# Altium project DT10965_MOTOR_CONTROLLER.PrjPcb (part 4 of 6)

## Sheet Phase_Current_Voltage_Sense.SchDoc: =DT_SCH_Title
size A3; Organization: Droid Technologies; DocumentNumber: DT10965; Revision: 1.0; SheetNumber: 20; SheetTotal: 21
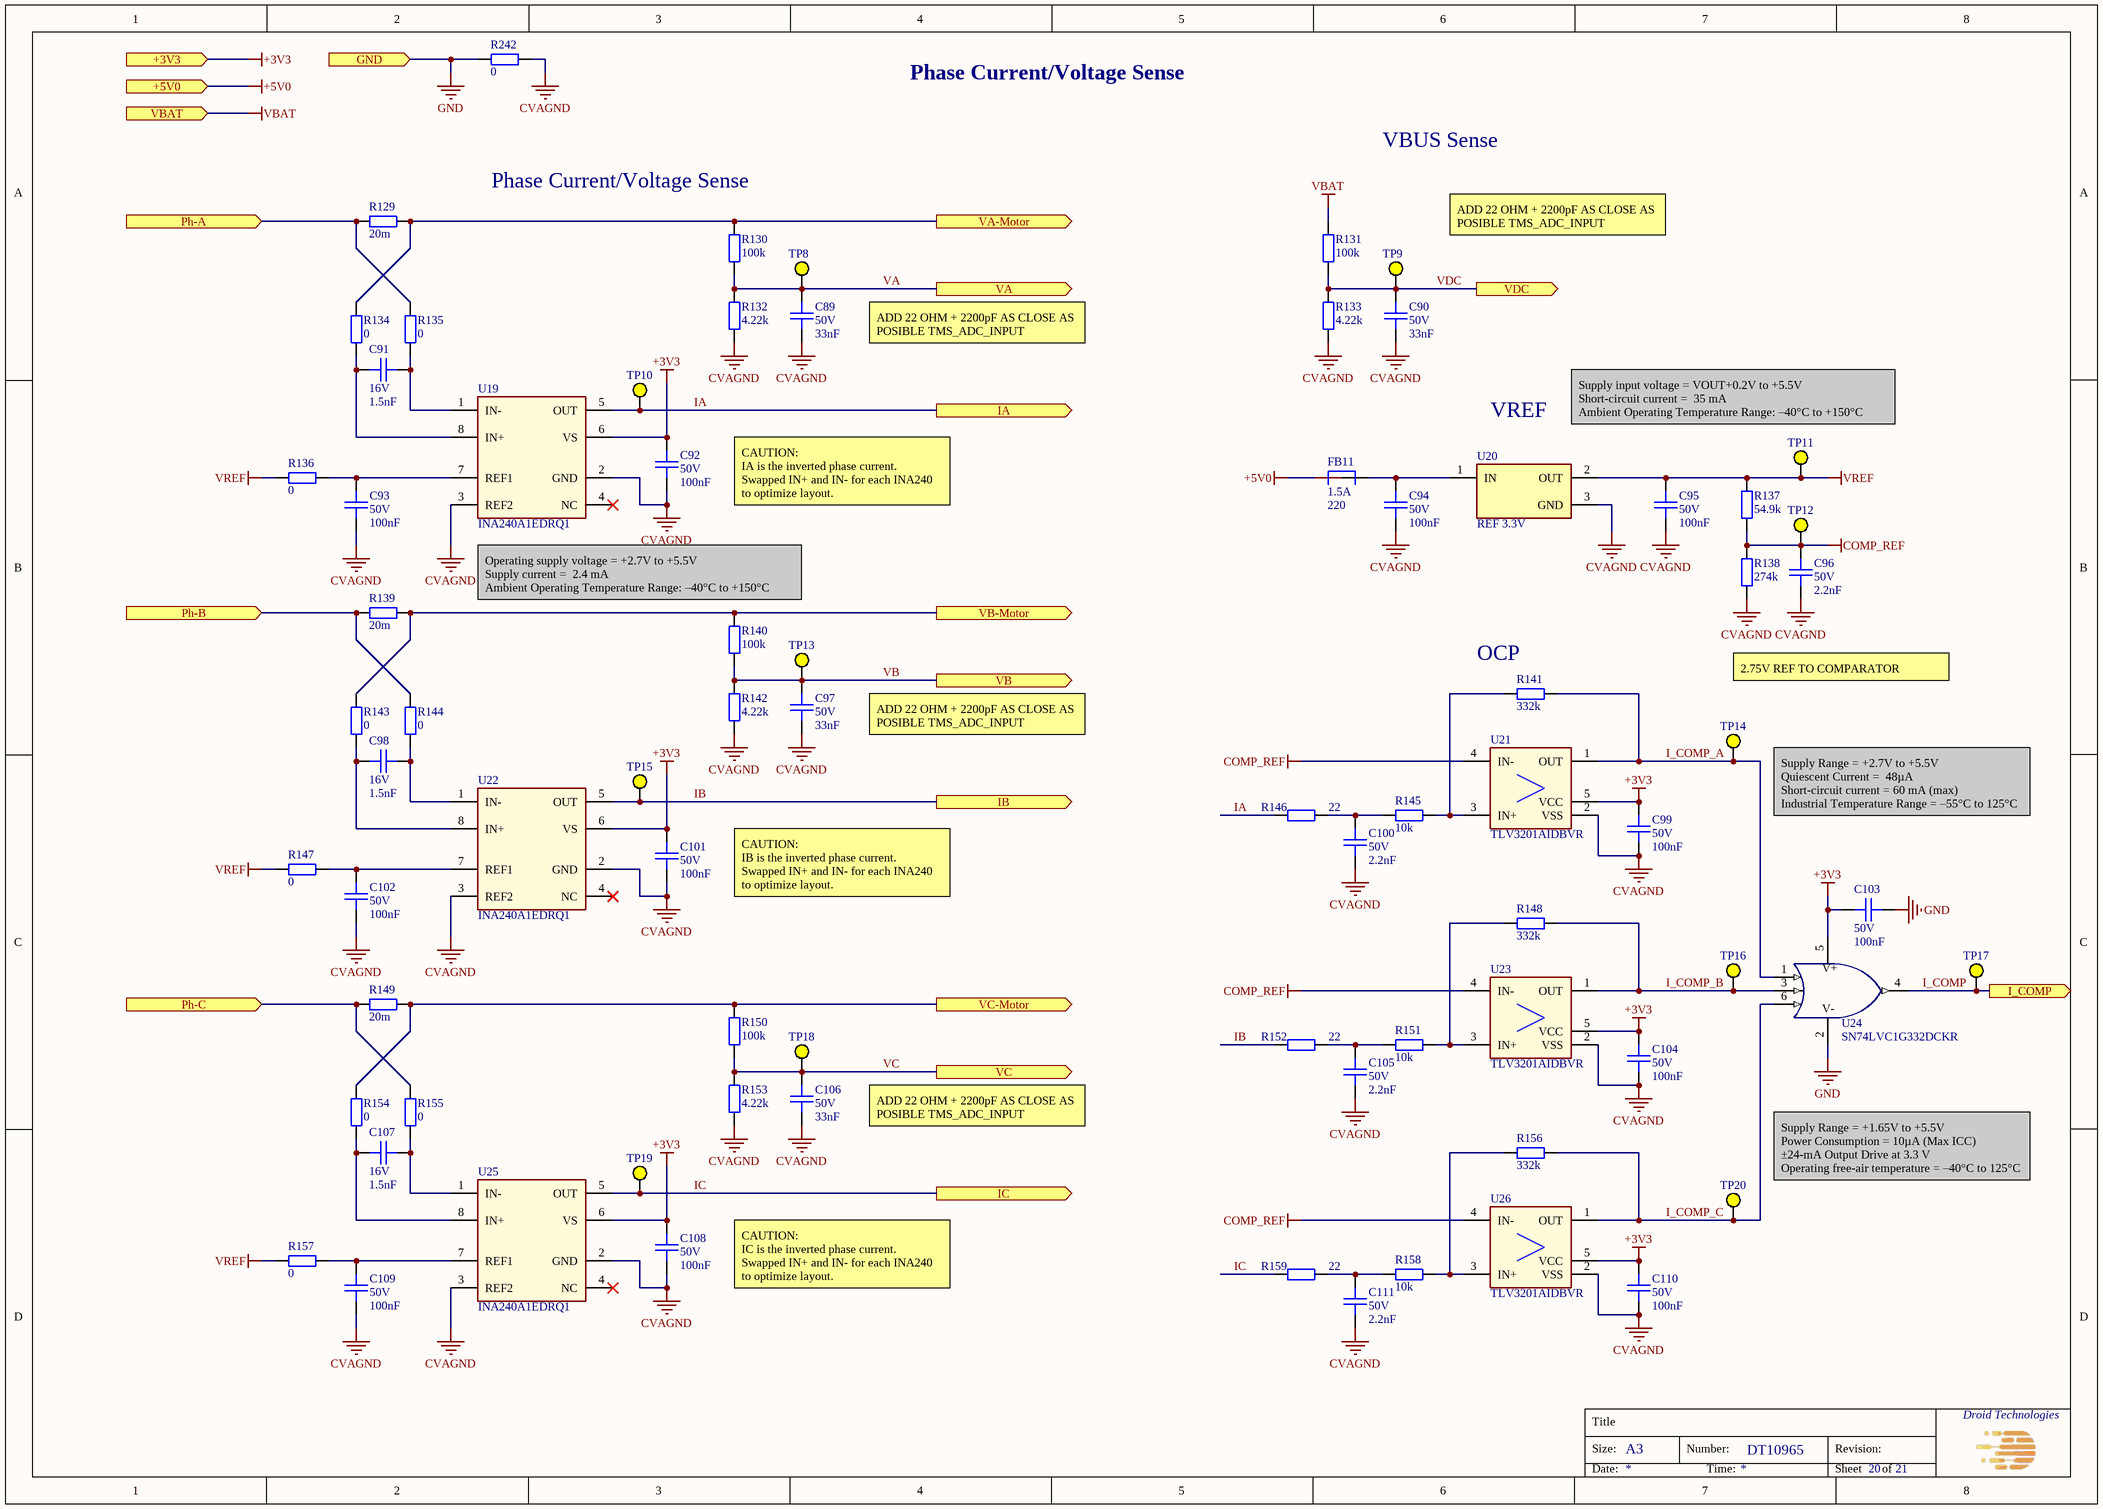
[diagram p10: Phase_Current_Voltage_Sense.SchDoc]

### Parts
C89  Voltage Rating: 50V  Capacitance: 33nF  [CAPC100x50x50L25]  (hidden comment: GCM155L8EH333KE07D)
C90  Voltage Rating: 50V  Capacitance: 33nF  [CAPC100x50x50L25]  (hidden comment: GCM155L8EH333KE07D)
C91  Voltage Rating: 16V  Capacitance: 1.5nF  [CAPC100x50x50L25]  (hidden comment: C0402C152F4HACAUTO)
C92  Voltage Rating: 50V  Capacitance: 100nF  [CAPC100x50x50L25]  (hidden comment: GCM155L8EH104KE07D)
C93  Voltage Rating: 50V  Capacitance: 100nF  [CAPC100x50x50L25]  (hidden comment: GCM155L8EH104KE07D)
C94  Voltage Rating: 50V  Capacitance: 100nF  [CAPC100x50x50L25]  (hidden comment: GCM155L8EH104KE07D)
C95  Voltage Rating: 50V  Capacitance: 100nF  [CAPC100x50x50L25]  (hidden comment: GCM155L8EH104KE07D)
C96  Voltage Rating: 50V  Capacitance: 2.2nF  [CAPC100x50x50L25]  (hidden comment: CGA2B2X8R1H222K050BA)
C97  Voltage Rating: 50V  Capacitance: 33nF  [CAPC100x50x50L25]  (hidden comment: GCM155L8EH333KE07D)
C98  Voltage Rating: 16V  Capacitance: 1.5nF  [CAPC100x50x50L25]  (hidden comment: C0402C152F4HACAUTO)
C99  Voltage Rating: 50V  Capacitance: 100nF  [CAPC100x50x50L25]  (hidden comment: GCM155L8EH104KE07D)
C100  Voltage Rating: 50V  Capacitance: 2.2nF  [CAPC100x50x50L25]  (hidden comment: CGA2B2X8R1H222K050BA)
C101  Voltage Rating: 50V  Capacitance: 100nF  [CAPC100x50x50L25]  (hidden comment: GCM155L8EH104KE07D)
C102  Voltage Rating: 50V  Capacitance: 100nF  [CAPC100x50x50L25]  (hidden comment: GCM155L8EH104KE07D)
C103  Voltage Rating: 50V  Capacitance: 100nF  [CAPC100x50x50L25]  (hidden comment: GCM155L8EH104KE07D)
C104  Voltage Rating: 50V  Capacitance: 100nF  [CAPC100x50x50L25]  (hidden comment: GCM155L8EH104KE07D)
C105  Voltage Rating: 50V  Capacitance: 2.2nF  [CAPC100x50x50L25]  (hidden comment: CGA2B2X8R1H222K050BA)
C106  Voltage Rating: 50V  Capacitance: 33nF  [CAPC100x50x50L25]  (hidden comment: GCM155L8EH333KE07D)
C107  Voltage Rating: 16V  Capacitance: 1.5nF  [CAPC100x50x50L25]  (hidden comment: C0402C152F4HACAUTO)
C108  Voltage Rating: 50V  Capacitance: 100nF  [CAPC100x50x50L25]  (hidden comment: GCM155L8EH104KE07D)
C109  Voltage Rating: 50V  Capacitance: 100nF  [CAPC100x50x50L25]  (hidden comment: GCM155L8EH104KE07D)
C110  Voltage Rating: 50V  Capacitance: 100nF  [CAPC100x50x50L25]  (hidden comment: GCM155L8EH104KE07D)
C111  Voltage Rating: 50V  Capacitance: 2.2nF  [CAPC100x50x50L25]  (hidden comment: CGA2B2X8R1H222K050BA)
FB11  Imax: 1.5A  Impedance: 220  [BEADC160X80X95L40]  (hidden comment: BLM18KG221BH1D)
R129  Resistance: 20m  [RC_CRA2512_Bourns]  (hidden comment: CRA2512-FZ-R020ELF)
R130  Resistance: 100k  [RESC100X50X40L25]  (hidden comment: RC0402FR-07100KL)
R131  Resistance: 100k  [RESC100X50X40L25]  (hidden comment: RC0402FR-07100KL)
R132  Resistance: 4.22k  [RESC100X50X40L25]  (hidden comment: RC0402FR-074K22L)
R133  Resistance: 4.22k  [RESC100X50X40L25]  (hidden comment: RC0402FR-074K22L)
R134  Resistance: 0  [RESC160X80X55L30]  (hidden comment: RC0603FR-070RL)
R135  Resistance: 0  [RESC160X80X55L30]  (hidden comment: RC0603FR-070RL)
R136  Resistance: 0  [RESC160X80X55L30]  (hidden comment: RC0603FR-070RL)
R137  Resistance: 54.9k  [RESC100X50X40L25]  (hidden comment: RC0402FR-0754K9L)
R138  Resistance: 274k  [RESC100X50X40L25]  (hidden comment: RC0402FR-07274KL)
R139  Resistance: 20m  [RC_CRA2512_Bourns]  (hidden comment: CRA2512-FZ-R020ELF)
R140  Resistance: 100k  [RESC100X50X40L25]  (hidden comment: RC0402FR-07100KL)
R141  Resistance: 332k  [RESC100X50X40L25]  (hidden comment: RC0402FR-07332KL)
R142  Resistance: 4.22k  [RESC100X50X40L25]  (hidden comment: RC0402FR-074K22L)
R143  Resistance: 0  [RESC160X80X55L30]  (hidden comment: RC0603FR-070RL)
R144  Resistance: 0  [RESC160X80X55L30]  (hidden comment: RC0603FR-070RL)
R145  Resistance: 10k  [RESC100X50X40L25]  (hidden comment: RC0402FR-0710KL)
R146  Resistance: 22  [RESC100X50X40L25]  (hidden comment: RC0402FR-0722RL)
R147  Resistance: 0  [RESC160X80X55L30]  (hidden comment: RC0603FR-070RL)
R148  Resistance: 332k  [RESC100X50X40L25]  (hidden comment: RC0402FR-07332KL)
R149  Resistance: 20m  [RC_CRA2512_Bourns]  (hidden comment: CRA2512-FZ-R020ELF)
R150  Resistance: 100k  [RESC100X50X40L25]  (hidden comment: RC0402FR-07100KL)
R151  Resistance: 10k  [RESC100X50X40L25]  (hidden comment: RC0402FR-0710KL)
R152  Resistance: 22  [RESC100X50X40L25]  (hidden comment: RC0402FR-0722RL)
R153  Resistance: 4.22k  [RESC100X50X40L25]  (hidden comment: RC0402FR-074K22L)
R154  Resistance: 0  [RESC160X80X55L30]  (hidden comment: RC0603FR-070RL)
R155  Resistance: 0  [RESC160X80X55L30]  (hidden comment: RC0603FR-070RL)
R156  Resistance: 332k  [RESC100X50X40L25]  (hidden comment: RC0402FR-07332KL)
R157  Resistance: 0  [RESC160X80X55L30]  (hidden comment: RC0603FR-070RL)
R158  Resistance: 10k  [RESC100X50X40L25]  (hidden comment: RC0402FR-0710KL)
R159  Resistance: 22  [RESC100X50X40L25]  (hidden comment: RC0402FR-0722RL)
R242  Resistance: 0  [RESC160X80X55L30]  (hidden comment: RC0603FR-070RL)
TP8  Test Point  [TP_D0.75mm]  (value not drawn)
TP9  Test Point  [TP_D0.75mm]  (value not drawn)
TP10  Test Point  [TP_D0.75mm]  (value not drawn)
TP11  Test Point  [TP_D0.75mm]  (value not drawn)
TP12  Test Point  [TP_D0.75mm]  (value not drawn)
TP13  Test Point  [TP_D0.75mm]  (value not drawn)
TP14  Test Point  [TP_D0.75mm]  (value not drawn)
TP15  Test Point  [TP_D0.75mm]  (value not drawn)
TP16  Test Point  [TP_D0.75mm]  (value not drawn)
TP17  Test Point  [TP_D0.75mm]  (value not drawn)
TP18  Test Point  [TP_D0.75mm]  (value not drawn)
TP19  Test Point  [TP_D0.75mm]  (value not drawn)
TP20  Test Point  [TP_D0.75mm]  (value not drawn)
U19  INA240A1EDRQ1  [SOIC8P127_490X600X175L70X41]
U20  REF 3.3V  [SOT-23]
U21  TLV3201AIDBVR  [SOP5P95_290X280X145L45X40]
U22  INA240A1EDRQ1  [SOIC8P127_490X600X175L70X41]
U23  TLV3201AIDBVR  [SOP5P95_290X280X145L45X40]
U24  SN74LVC1G332DCKR  [SC70-6]
U25  INA240A1EDRQ1  [SOIC8P127_490X600X175L70X41]
U26  TLV3201AIDBVR  [SOP5P95_290X280X145L45X40]

### Ports
+3V3 (in), +5V0 (in), GND (in), I_COMP (out), IA (out), IB (out), IC (out), Ph-A (in), Ph-B (in), Ph-C (in), VA (out), VA-Motor (out), VB (out), VB-Motor (out), VBAT (in), VC (out), VC-Motor (out), VDC (out)

### Nets
+3V3: C92.2 C99.2 C101.2 C103.2 C104.2 C108.2 C110.2 U19.6(VS) U21.5(VCC) U22.6(VS) U23.5(VCC) U24.5(VCC) U25.6(VS) U26.5(VCC) ; port +3V3
+5V0: FB11.1 ; port +5V0
COMP_REF: C96.2 R137.1 R138.2 TP12.1 U21.4(IN-) U23.4(IN-) U26.4(IN-)
CVAGND: C89.1 C90.1 C92.1 C93.1 C94.1 C95.1 C96.1 C97.1 C99.1 C100.1 C101.1 C102.1 C104.1 C105.1 C106.1 C108.1 C109.1 C110.1 C111.1 R132.1 R133.1 R138.1 R142.1 R153.1 R242.1 U19.2(GND) U19.3(REF2) U20.3(GND) U21.2(VSS) U22.2(GND) U22.3(REF2) U23.2(VSS) U25.2(GND) U25.3(REF2) U26.2(VSS)
GND: C103.1 R242.2 U24.2(GND) ; port GND
VBAT: R131.2 ; port VBAT
VREF: C95.2 R136.1 R137.2 R147.1 R157.1 TP11.1 U20.2(OUT)
I_COMP: TP17.1 U24.4(Y) ; port I_COMP
I_COMP_A: R141.2 TP14.1 U21.1(OUT) U24.1(A)
I_COMP_B: R148.2 TP16.1 U23.1(OUT) U24.3(B)
I_COMP_C: R156.2 TP20.1 U24.6(C) U26.1(OUT)
IA: R146.1 TP10.1 U19.5(OUT) ; port IA
IB: R152.1 TP15.1 U22.5(OUT) ; port IB
IC: R159.1 TP19.1 U25.5(OUT) ; port IC
VA: C89.2 R130.1 R132.2 TP8.1 ; port VA
VB: C97.2 R140.1 R142.2 TP13.1 ; port VB
VC: C106.2 R150.1 R153.2 TP18.1 ; port VC
VDC: C90.2 R131.1 R133.2 TP9.1 ; port VDC
NetC70_1: R129.1 R135.2 ; port Ph-A
NetC77_1: R139.1 R144.2 ; port Ph-B
NetC85_1: R149.1 R155.2 ; port Ph-C
NetC91_1: C91.1 R135.1 U19.1(IN-)
NetC91_2: C91.2 R134.1 U19.8(IN+)
NetC93_2: C93.2 R136.2 U19.7(REF1)
NetC94_2: C94.2 FB11.2 U20.1(IN)
NetC98_1: C98.1 R144.1 U22.1(IN-)
NetC98_2: C98.2 R143.1 U22.8(IN+)
NetC100_2: C100.2 R145.1 R146.2
NetC102_2: C102.2 R147.2 U22.7(REF1)
NetC105_2: C105.2 R151.1 R152.2
NetC107_1: C107.1 R155.1 U25.1(IN-)
NetC107_2: C107.2 R154.1 U25.8(IN+)
NetC109_2: C109.2 R157.2 U25.7(REF1)
NetC111_2: C111.2 R158.1 R159.2
NetR129_2: R129.2 R130.2 R134.2 ; port VA-Motor
NetR139_2: R139.2 R140.2 R143.2 ; port VB-Motor
NetR141_1: R141.1 R145.2 U21.3(IN+)
NetR148_1: R148.1 R151.2 U23.3(IN+)
NetR149_2: R149.2 R150.2 R154.2 ; port VC-Motor
NetR156_1: R156.1 R158.2 U26.3(IN+)

Not connected (* = marked no-connect by the designer): U19 4(NC)*; U22 4(NC)*; U25 4(NC)*

### Notes on the sheet
- Phase Current/Voltage Sense
- VBUS Sense
- (near R130) Phase Current/Voltage Sense
- ADD 22 OHM + 2200pF AS CLOSE AS POSIBLE TMS_ADC_INPUT
- VREF
- Supply input voltage = VOUT+0.2V to +5.5V
  Short-circuit current =  35 mA
  Ambient Operating Temperature Range: –40°C to +150°C
- CAUTION:
  IA is the inverted phase current.
  Swapped IN+ and IN- for each INA240 to optimize layout.
- Operating supply voltage = +2.7V to +5.5V
  Supply current =  2.4 mA
  Ambient Operating Temperature Range: –40°C to +150°C
- (near R141) OCP
- 2.75V REF TO COMPARATOR
- (near TP14) Supply Range = +2.7V to +5.5V
  Quiescent Current =  48µA
  Short-circuit current = 60 mA (max)
  Industrial Temperature Range = –55°C to 125°C
- CAUTION:
  IB is the inverted phase current.
  Swapped IN+ and IN- for each INA240 to optimize layout.
- (near TP20) Supply Range = +1.65V to +5.5V
  Power Consumption = 10µA (Max ICC)
  ±24-mA Output Drive at 3.3 V
  Operating free-air temperature = –40°C to 125°C
- CAUTION:
  IC is the inverted phase current.
  Swapped IN+ and IN- for each INA240 to optimize layout.
- Title
- Size:
- A3
- Number:
- Revision:
- Date:
- Time:
- Sheet
- of
- (in symbol SN74LVC1G332DCKR) V+; V-

### Library data of the parts
C89 C90 C97 C106 = CMP-001-2007-2: CAP CER 0.033UF 50V X8L 0402; Manufacturer: Murata Electronics; Op Temp max: 150°C; Tolerance: 10%; Op Temp min: -55°C; ComponentLink1URL: https://www.murata.com/en-us/products/productdetail?partno=GCM155L8EH333KE07%23; Mounting Type: SM; Dielectric: X8L; ComponentLink3URL: https://www.digikey.com/en/products/detail/murata-electronics/GCM155L8EH333KE07D/17845188; Size: 1.00mm x 0.50mm; ComponentLink1Description: Datasheet; ComponentLink3Description: Digikey; Package: 0402 (1005 Metric); MPN: GCM155L8EH333KE07D; ComponentLink2Description: Mouser; Height max: 550µm; Lead Spacing: 0mm; ComponentLink2URL: https://eu.mouser.com/ProductDetail/Murata-Electronics/GCM155L8EH333KE07D?qs=rrS6PyfT74cZK6FfR7MiFw%3D%3D; Ratings: AEC-Q200
C91 C98 C107 = CMP-001-2006-2: CAP CER 0402 1.5NF 16V ULTRA STA; Manufacturer: KEMET; Op Temp min: -55°C; Op Temp max: 150°C; Dielectric: X8R; Tolerance: 1%; Ratings: AEC-Q200; Lead Spacing: 0mm; Package: 0402 (1005 Metric); Size: 1.00mm x 0.50mm; ComponentLink3URL: https://www.digikey.com/en/products/detail/kemet/C0402C152F4HACAUTO/7955197?s=N4IgjCBcpgLFoDGUBmBDANgZwKYBoQB7KAbXAAYAOAdlgCYQBdAgBwBcoQBlNgJwEsAdgHMQAXwJgAbAhDJI6bPiKkQAZgCcYAKyUmrDpG58hoiSDraG0Oaky4CxSGTr0NaiMxDtOPASPECanJqWXlFBxVndTA6MHJtfW9DY38zSQ1KDTC7JUdVciZzOnJYbJtw%2B2UnMh1ycgACFgAxJJ8jAFVBfjYAeRQAWRw0LABXXhxAkABaayQoPlHq1UTGMWLVOvIWFCKgA; ComponentLink2Description: Mouser; ComponentLink3Description: Digikey; ComponentLink1URL: https://www.kemet.com/en/us/product/C0402C152F4HACAUTO.html; Mounting Type: SM; MPN: C0402C152F4HACAUTO; Height max: 550µm; ComponentLink1Description: Datasheet; ComponentLink2URL: https://eu.mouser.com/ProductDetail/KEMET/C0402C152F4HACAUTO?qs=j%252B1pi9TdxUbEW1hCqLU6QA%3D%3D
C92-C95 C99 C101-C104 C108-C110 = CMP-001-1980-2: as C59-C62 on sheet Accelerometers; Height max: 550µm; ComponentLink3Description: Digikey; Mounting Type: SM; ComponentLink3URL: https://www.digikey.com/en/products/detail/murata-electronics/GCM155L8EH104KE07D/11618823; Package: 0402 (1005 Metric); Lead Spacing: 0mm; MPN: GCM155L8EH104KE07D; Size: 1.00mm x 0.50mm; Ratings: AEC-Q200; ComponentLink1URL: https://www.murata.com/en-us/products/productdetail?partno=GCM155L8EH104KE07%23; ComponentLink1Description: Datasheet; Dielectric: X8L; ComponentLink2Description: Mouser; ComponentLink2URL: https://eu.mouser.com/ProductDetail/Murata-Electronics/GCM155L8EH104KE07D?qs=1mbolxNpo8fQSHf0HYnZWw%3D%3D
C96 C100 C105 C111 = CMP-001-2008-2: CAP CER 2200PF 50V X8R 0402; Manufacturer: TDK Corporation; Op Temp max: 150°C; Op Temp min: -55°C; Tolerance: 10%; Size: 1.00mm x 0.50mm; ComponentLink1URL: https://product.tdk.com/en/search/capacitor/ceramic/mlcc/info?part_no=CGA2B2X8R1H222K050BA; ComponentLink3Description: Digikey; Mounting Type: SM; Ratings: AEC-Q200; ComponentLink3URL: https://www.digikey.com/en/products/detail/tdk-corporation/CGA2B2X8R1H222K050BA/2443359; Dielectric: X8R; ComponentLink2URL: https://eu.mouser.com/ProductDetail/TDK/CGA2B2X8R1H222K050BA?qs=NRhsANhppD9e0pyGSMWEuA%3D%3D; Height max: 550µm; ComponentLink1Description: Datasheet; Package: 0402 (1005 Metric); ComponentLink2Description: Mouser; MPN: CGA2B2X8R1H222K050BA; Lead Spacing: 0mm
FB11 = CMP-001-1981-1: as FB8-FB10 on sheet Accelerometers; Mounting Type: SM; Size: 1.60mm x 0.80mm; ComponentLink2URL: https://eu.mouser.com/ProductDetail/Murata-Electronics/BLM18KG221BH1D?qs=sJ5gq5MLFXpgEHYBdWUtkQ%3D%3D; ComponentLink1Description: Datasheet; ComponentLink1URL: https://www.murata.com/en-us/products/productdata/8798137286686/QNFA9129.pdf; Lead Spacing: 0mm; Ratings: AEC-Q200; ComponentLink3Description: Digikey; ComponentLink3URL: https://www.digikey.com/en/products/detail/murata-electronics/BLM18KG221BH1D/6156000; Height max: 950µm; Package: 0603 (1608 Metric); ComponentLink2Description: Mouser; MPN: BLM18KG221BH1D
R129 R139 R149 = RC_CRA2512-FZ-R020ELF: RES 0.02 OHM 1% 3W 2512; Manufacturer: Bourns Inc.; Temperature Coefficient: ±50ppm/°C; Op Temp min: -55°C; Op Temp max: 170°C; Ratings: Automotive AEC-Q200; Package: 2512 (6332 Metric); MPN: CRA2512-FZ-R020ELF; Size: 6.45mm x 3.35mm; ComponentLink1Description: Datasheet; Power: 3W; ComponentLink3Description: Digikey; ComponentLink2URL: https://eu.mouser.com/ProductDetail/Bourns/CRA2512-FZ-R020ELF?qs=WqWCsLCZBkqBWIN8p659hA%3D%3D; Mounting Type: SM; Composition: Metal Element; ComponentLink3URL: https://www.digikey.com/en/products/detail/bourns-inc/CRA2512-FZ-R020ELF/1775030; Tolerance: ±1%; Height max: 0.90mm; ComponentLink2Description: Mouser; ComponentLink1URL: https://www.bourns.com/docs/product-datasheets/cra.pdf; Component Type: Chip Resistor
R130 R131 R140 R150 = CMP-00121-6: RES 100K OHM 1% 1/16W 0402; Manufacturer: YAGEO; Op Temp min: -55°C; Op Temp max: 155°C; Power: 63mW; Temperature Coefficient: ±100ppm; ComponentLink2Description: Mouser; Mounting Type: SM; Composition: Thick Film; ComponentLink3URL: https://www.digikey.com/en/products/detail/yageo/RC0402FR-07100KL/726526; Size: 1.00mm x 0.50mm; MPN: RC0402FR-07100KL; Tolerance: 1%; Ratings: -; ComponentLink1Description: Datasheet; ComponentLink2URL: https://eu.mouser.com/ProductDetail/YAGEO/RC0402FR-07100KL?qs=%2Fha2pyFaduhjtLcYvKXQ8IUndG0u%252BuCx1gxMxvN%252Btd7iB7mgHWsSbw%3D%3D; Package: 0402 (1005 Metric); ComponentLink1URL: https://www.yageo.com/upload/media/product/productsearch/datasheet/rchip/PYu-RC_Group_51_RoHS_L_12.pdf; ComponentLink3Description: Digikey; Height max: 400µm
R132 R133 R142 R153 = CMP-00686-2: RES 4.22K OHM 1% 1/16W 0402; Manufacturer: YAGEO; Temperature Coefficient: ±100ppm; Op Temp max: 155°C; Op Temp min: -55°C; Power: 63mW; Height max: 400µm; Tolerance: 1%; Mounting Type: SM; ComponentLink2URL: https://eu.mouser.com/ProductDetail/YAGEO/RC0402FR-074K22L?qs=UOUeRUa%252B8WlIkeLfnYGqDQ%3D%3D; ComponentLink3URL: https://www.digikey.com/en/products/detail/yageo/RC0402FR-074K22L/5281032?s=N4IgTCBcDaIEoGEAMAWJYBicC0SDsKA0mGADIgC6AvkA; ComponentLink2Description: Mouser; Package: 0402 (1005 Metric); ComponentLink3Description: Digikey; MPN: RC0402FR-074K22L; Ratings: -; ComponentLink1Description: Datasheet; ComponentLink1URL: https://www.yageo.com/upload/media/product/productsearch/datasheet/rchip/PYu-RC_Group_51_RoHS_L_12.pdf; Composition: Thick Film; Size: 1.00mm x 0.50mm
R134-R136 R143 R144 R147 R154 R155 R157 R242 = CMP-001-0927-2: RES 0 OHM JUMPER 1/10W 0603; Manufacturer: YAGEO; Op Temp min: -55°C; Op Temp max: 155°C; Power: 100mW; Tolerance: 0%; Height max: 550µm; ComponentLink2URL: https://eu.mouser.com/ProductDetail/YAGEO/RC0603FR-070RL?qs=0yPvnVz5%2FmpDQv43TwvCfw%3D%3D; Temperature Coefficient: -; ComponentLink3Description: Digikey; ComponentLink2Description: Mouser; MPN: RC0603FR-070RL; ComponentLink1URL: https://www.yageo.com/upload/media/product/productsearch/datasheet/rchip/PYu-RC_Group_51_RoHS_L_12.pdf; Ratings: -; Size: 1.60mm x 0.80mm; Composition: Thick Film; Mounting Type: SM; ComponentLink3URL: https://www.digikey.com/en/products/detail/yageo/RC0603FR-070RL/1304008; Package: 0603 (1608 Metric); ComponentLink1Description: Datasheet
R137 = CMP-001-1595-1: RES 54.9K OHM 1% 1/16W 0402; Manufacturer: YAGEO; Op Temp max: 155°C; Power: 63mW; Op Temp min: -55°C; Temperature Coefficient: ±100ppm; Size: 1.00mm x 0.50mm; Composition: Thick Film; Ratings: -; ComponentLink1Description: Datasheet; Tolerance: 1%; ComponentLink2URL: https://eu.mouser.com/ProductDetail/YAGEO/RC0402FR-0754K9L?qs=4PGqJHn8QVJggq6NOjvQiQ%3D%3D; Package: 0402 (1005 Metric); ComponentLink3URL: https://www.digikey.com/en/products/detail/yageo/RC0402FR-0754K9L/5281045; Mounting Type: SM; MPN: RC0402FR-0754K9L; ComponentLink3Description: Digikey; ComponentLink2Description: Mouser; Height max: 400µm; ComponentLink1URL: https://www.yageo.com/upload/media/product/products/datasheet/rchip/PYu-RC_Group_51_RoHS_L_12.pdf
R138 = CMP-00590-3: RES 274K OHM 1% 1/16W 0402; Manufacturer: YAGEO; Op Temp min: -55°C; Op Temp max: 155°C; Temperature Coefficient: ±100ppm; Power: 63mW; MPN: RC0402FR-07274KL; ComponentLink3Description: Digikey; Ratings: -; ComponentLink2Description: Mouser; ComponentLink1URL: https://www.yageo.com/upload/media/product/productsearch/datasheet/rchip/PYu-RC_Group_51_RoHS_L_12.pdf; Size: 1.00mm x 0.50mm; ComponentLink1Description: Datasheet; Tolerance: 1%; Height max: 400µm; Package: 0402 (1005 Metric); Composition: Thick Film; ComponentLink3URL: https://www.digikey.com/en/products/detail/yageo/RC0402FR-07274KL/5280943?s=N4IgTCBcDaIEoGEAMAWJYBicC0SDsYeKA0gDIgC6AvkA; Mounting Type: SM; ComponentLink2URL: https://eu.mouser.com/ProductDetail/YAGEO/RC0402FR-07274KL?qs=UOUeRUa%252B8WkXvujgT9w63w%3D%3D
R141 R148 R156 = CMP-00670-2: RES 332K OHM 1% 1/16W 0402; Manufacturer: YAGEO; Op Temp max: 155°C; Temperature Coefficient: ±100ppm; Power: 63mW; Op Temp min: -55°C; Size: 1.00mm x 0.50mm; ComponentLink1Description: Datasheet; Composition: Thick Film; Package: 0402 (1005 Metric); Height max: 400µm; Ratings: -; ComponentLink2Description: Mouser; ComponentLink3Description: Digikey; MPN: RC0402FR-07332KL; ComponentLink1URL: https://www.yageo.com/upload/media/product/productsearch/datasheet/rchip/PYu-RC_Group_51_RoHS_L_12.pdf; ComponentLink2URL: https://eu.mouser.com/ProductDetail/YAGEO/RC0402FR-07332KL?qs=5YWhraou11DzMN0bHRRHtQ%3D%3D; ComponentLink3URL: https://www.digikey.com/en/products/detail/yageo/RC0402FR-07332KL/726595?s=N4IgTCBcDaIEoGEAMAWJYBicC0SDsAzAWANIAyIAugL5A; Mounting Type: SM; Tolerance: 1%
R145 R151 R158 = CMP-00010-6: RES 10K OHM 1% 1/16W 0402; Manufacturer: YAGEO; Op Temp max: 155°C; Op Temp min: -55°C; Power: 63mW; Temperature Coefficient: ±100ppm; ComponentLink3URL: https://www.digikey.com/en/products/detail/yageo/RC0402FR-0710KL/726523; ComponentLink1Description: Datasheet; Height max: 400µm; ComponentLink3Description: Digikey; ComponentLink2URL: https://www2.mouser.com/ProductDetail/YAGEO/RC0402FR-0710KL?qs=%2Fha2pyFaduhjtLcYvKXQ8NAGbRXkQ%2Fwl6RsvWHeV66MSeqLhkcF3rg%3D%3D; Ratings: -; MPN: RC0402FR-0710KL; ComponentLink1URL: https://www.yageo.com/upload/media/product/productsearch/datasheet/rchip/PYu-RC_Group_51_RoHS_L_12.pdf; ComponentLink2Description: Mouser; Mounting Type: SM; Tolerance: 1%; Composition: Thick Film; Size: 1.00mm x 0.50mm; Package: 0402 (1005 Metric)
R146 R152 R159 = CMP-001-0482-4: as R99-R102 on sheet Accelerometers; Ratings: -; ComponentLink3URL: https://www.digikey.com/en/products/detail/yageo/RC0402FR-0722RL/726562; ComponentLink2URL: https://eu.mouser.com/ProductDetail/YAGEO/RC0402FR-0722RL?qs=V1yeUXFNrkkRg6zf08ADKQ%3D%3D; MPN: RC0402FR-0722RL; ComponentLink1Description: Datasheet; ComponentLink3Description: Digikey; Tolerance: 1%; Size: 1.00mm x 0.50mm; ComponentLink1URL: https://www.yageo.com/upload/media/product/productsearch/datasheet/rchip/PYu-RC_Group_51_RoHS_L_12.pdf; Composition: Thick Film; ComponentLink2Description: Mouser; Mounting Type: SM; Package: 0402 (1005 Metric); Height max: 400µm
TP8-TP20 = TP_0.75: Test point 0.75mm
U19 U22 U25 = INA240A1EDRQ1: IC CURRENT SENSE 1 CIRCUIT 8SOIC; Manufacturer: Texas Instruments; MPN: INA240A1EDRQ1
U20 = REF3333AIDBZR: IC VREF SERIES 0.15% SOT23-3; Manufacturer: Texas Instruments; MPN: REF3333AIDBZR
U21 U23 U26 = CMP-001-2009-1: IC COMPARATOR 1 GEN PUR SOT23-5; Manufacturer: Texas Instruments; Op Temp max: 125°C; Current - Quiescent (Max): 40µA; Output Type: Push-Pull; Propagation Delay (Max): 50ns; Number of Elements: 1; Op Temp min: -40°C; Hysteresis: 1.2mV; Current - Input Bias (Max): 0.005µA @ 5V; Voltage - Input Offset (Max): 1mV @ 5V; CMRR, PSRR (Typ): 70dB CMRR, 85dB PSRR; Current - Output (Typ): 21mA; Voltage - Supply, Single/Dual (±): 2.7V ~ 5.5V; ComponentLink1Description: Datasheet; ComponentLink1URL: https://www.ti.com/lit/ds/symlink/tlv3201.pdf?HQS=dis-dk-null-digikeymode-dsf-pf-null-wwe&ts=1745660417910&ref_url=https%253A%252F%252Fwww.ti.com%252Fgeneral%252Fdocs%252Fsuppproductinfo.tsp%253FdistId%253D10%2526gotoUrl%253Dhttps%253A%252F%252Fwww.ti.com%252Flit%252Fgpn%252Ftlv3201; ComponentLink2Description: Mouser; Mounting Type: SM; ComponentLink3URL: https://www.digikey.com/en/products/detail/texas-instruments/TLV3201AIDBVR/3188691?s=N4IgTCBcDaICoBkBqBmMAGAjAQQJIBEAhJAJRAF0BfIA; ComponentLink2URL: https://eu.mouser.com/ProductDetail/Texas-Instruments/TLV3201AIDBVR?qs=5771e39Rz9GGuYwPEKy7fA%3D%3D; ComponentLink3Description: Digikey; Package: SC-74A, SOT-753; Ratings: -; MPN: TLV3201AIDBVR
U24 = SN74LVC1G332DCKR: IC GATE OR 1CH 3-INP SC70-6; Manufacturer: Texas Instruments; MPN: SN74LVC1G332DCKR

## Sheet Pressure_sensor_AFE1.SchDoc: =DT_SCH_Title
size A4; Organization: Droid Technologies; DocumentNumber: DT10965; Revision: 1.0; SheetNumber: 19; SheetTotal: 21
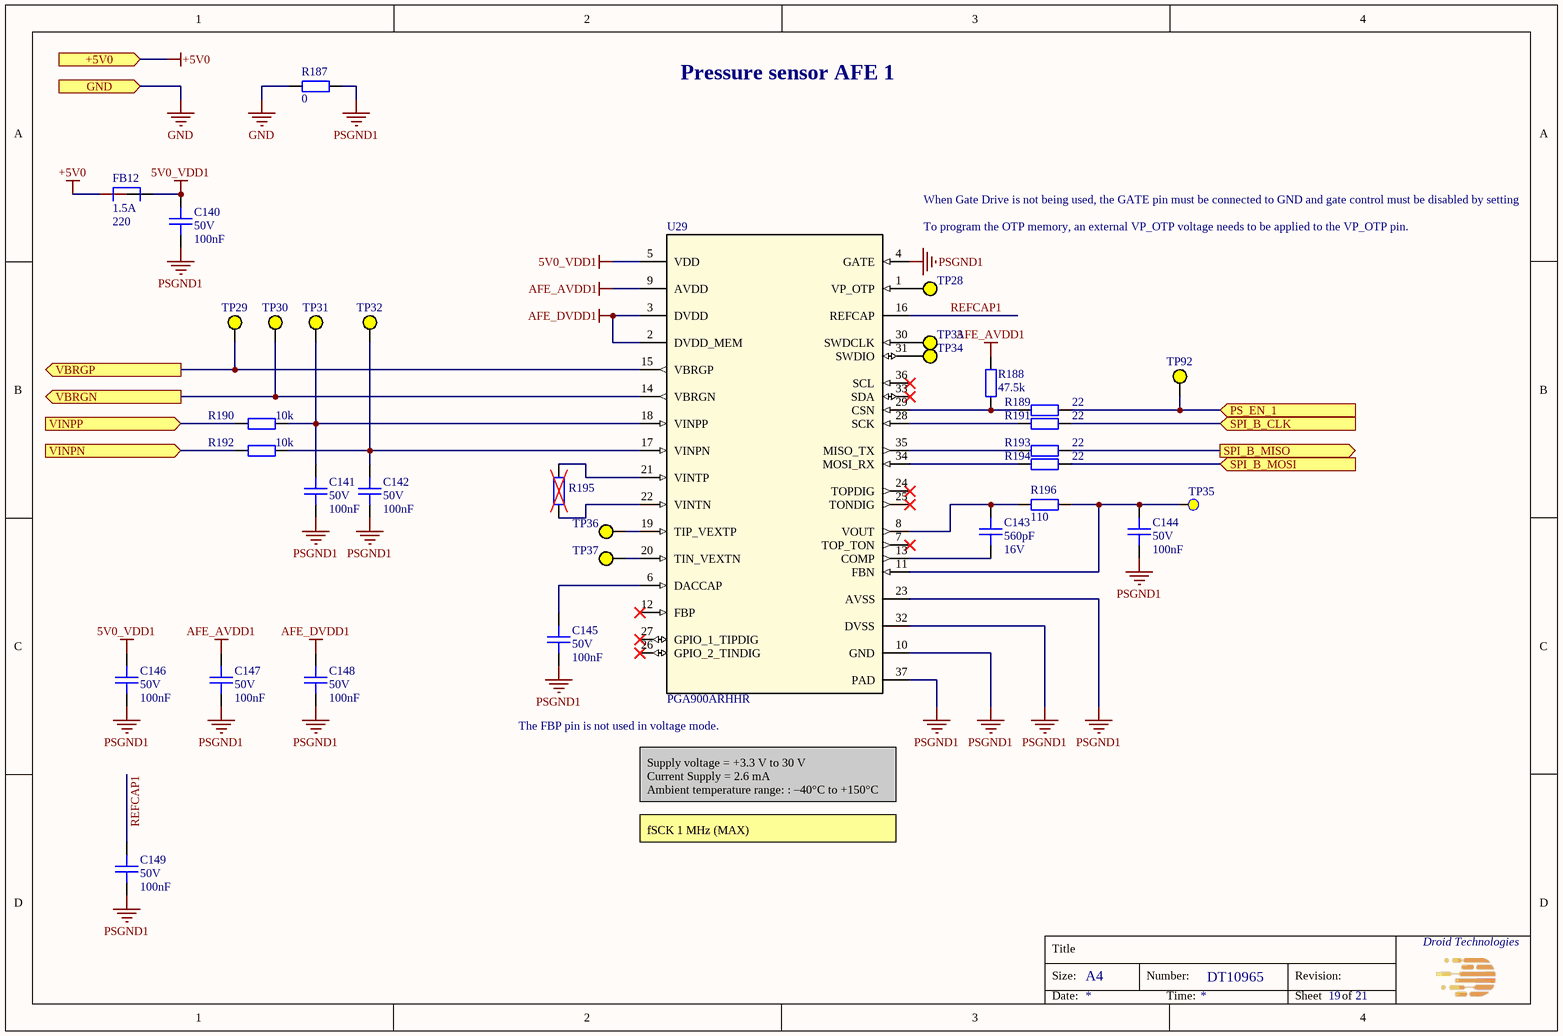
[diagram p11: Pressure_sensor_AFE1.SchDoc]

### Parts
C140  Voltage Rating: 50V  Capacitance: 100nF  [CAPC100x50x50L25]  (hidden comment: GCM155L8EH104KE07D)
C141  Voltage Rating: 50V  Capacitance: 100nF  [CAPC100x50x50L25]  (hidden comment: GCM155L8EH104KE07D)
C142  Voltage Rating: 50V  Capacitance: 100nF  [CAPC100x50x50L25]  (hidden comment: GCM155L8EH104KE07D)
C143  Capacitance: 560pF  Voltage Rating: 16V  [CAPC100x50x50L25]  (hidden comment: C0402C561F4HACAUTO)
C144  Voltage Rating: 50V  Capacitance: 100nF  [CAPC100x50x50L25]  (hidden comment: GCM155L8EH104KE07D)
C145  Voltage Rating: 50V  Capacitance: 100nF  [CAPC100x50x50L25]  (hidden comment: GCM155L8EH104KE07D)
C146  Voltage Rating: 50V  Capacitance: 100nF  [CAPC100x50x50L25]  (hidden comment: GCM155L8EH104KE07D)
C147  Voltage Rating: 50V  Capacitance: 100nF  [CAPC100x50x50L25]  (hidden comment: GCM155L8EH104KE07D)
C148  Voltage Rating: 50V  Capacitance: 100nF  [CAPC100x50x50L25]  (hidden comment: GCM155L8EH104KE07D)
C149  Voltage Rating: 50V  Capacitance: 100nF  [CAPC100x50x50L25]  (hidden comment: GCM155L8EH104KE07D)
FB12  Imax: 1.5A  Impedance: 220  [BEADC160X80X95L40]  (hidden comment: BLM18KG221BH1D)
R187  Resistance: 0  [RESC160X80X55L30]  (hidden comment: RC0603FR-070RL)
R188  Resistance: 47.5k  [RESC100X50X40L25]  (hidden comment: RC0402FR-0747K5L)
R189  Resistance: 22  [RESC100X50X40L25]  (hidden comment: RC0402FR-0722RL)
R190  Resistance: 10k  [RESC100X50X40L25]  (hidden comment: RC0402FR-0710KL)
R191  Resistance: 22  [RESC100X50X40L25]  (hidden comment: RC0402FR-0722RL)
R192  Resistance: 10k  [RESC100X50X40L25]  (hidden comment: RC0402FR-0710KL)
R193  Resistance: 22  [RESC100X50X40L25]  (hidden comment: RC0402FR-0722RL)
R194  Resistance: 22  [RESC100X50X40L25]  (hidden comment: RC0402FR-0722RL)
R195  DNP chip res 0603  [RESC160X80X55L30]  (value not drawn)
R196  Resistance: 110  [RESC100X50X40L25]  (hidden comment: RC0402FR-07110RL)
TP28  Test Point  [TP_D1.5mm]  (value not drawn)  (no BOM)
TP29  Test Point  [TP_D0.75mm]  (value not drawn)
TP30  Test Point  [TP_D0.75mm]  (value not drawn)
TP31  Test Point  [TP_D0.75mm]  (value not drawn)
TP32  Test Point  [TP_D0.75mm]  (value not drawn)
TP33  Test Point  [TP_D1.5mm]  (value not drawn)  (no BOM)
TP34  Test Point  [TP_D1.5mm]  (value not drawn)  (no BOM)
TP35  TPAD  [PAD_1.0R]  (value not drawn)  (no BOM)
TP36  Test Point  [TP_D1.5mm]  (value not drawn)  (no BOM)
TP37  Test Point  [TP_D1.5mm]  (value not drawn)  (no BOM)
TP92  Test Point  [TP_D0.75mm]  (value not drawn)
U29  PGA900ARHHR  [36VQFN]

### Ports
+5V0 (in), GND (in), PS_EN_1 (in), SPI_B_CLK (in), SPI_B_MISO (out), SPI_B_MOSI (in), VBRGN (out), VBRGP (out), VINPN (in), VINPP (in)

### Nets
5V0_VDD1: C140.2 C146.2 FB12.2 U29.5(VDD)
+5V0: FB12.1 ; port +5V0
AFE_AVDD1: C147.2 R188.2 U29.9(AVDD)
AFE_DVDD1: C148.2 U29.2(DVDD_MEM) U29.3(DVDD)
GND: R187.2 ; port GND
PSGND1: C140.1 C141.1 C142.1 C144.1 C145.1 C146.1 C147.1 C148.1 C149.1 R187.1 U29.4(GATE) U29.10(GND) U29.23(AVSS) U29.32(DVSS) U29.37(PAD)
REFCAP1: C149.2 U29.16(REFCAP)
SPI_B_CLK: R191.2 ; port SPI_B_CLK
SPI_B_MISO: R193.2 ; port SPI_B_MISO
SPI_B_MOSI: R194.2 ; port SPI_B_MOSI
NetC141_2: C141.2 R190.2 TP31.1 U29.18(VINPP)
NetC142_2: C142.2 R192.2 TP32.1 U29.17(VINPN)
NetC143_1: C143.1 U29.13(COMP)
NetC143_2: C143.2 R196.1 U29.8(VOUT)
NetC144_2: C144.2 R196.2 TP35.1(TPoint) U29.11(FBN)
NetC145_2: C145.2 U29.6(DACCAP)
NetR188_1: R188.1 R189.1 U29.29(CSN)
NetR189_2: R189.2 TP92.1 ; port PS_EN_1
NetR190_1: R190.1 ; port VINPP
NetR191_1: R191.1 U29.28(SCK)
NetR192_1: R192.1 ; port VINPN
NetR193_1: R193.1 U29.35(MISO_TX)
NetR194_1: R194.1 U29.34(MOSI_RX)
NetR195_1: R195.1 U29.22(VINTN)
NetR195_2: R195.2 U29.21(VINTP)
NetTP28_1: TP28.1 U29.1(VP_OTP)
NetTP29_1: TP29.1 U29.15(VBRGP) ; port VBRGP
NetTP30_1: TP30.1 U29.14(VBRGN) ; port VBRGN
NetTP33_1: TP33.1 U29.30(SWDCLK)
NetTP34_1: TP34.1 U29.31(SWDIO)
NetTP36_1: TP36.1 U29.19(TIP_VEXTP)
NetTP37_1: TP37.1 U29.20(TIN_VEXTN)

Not connected (* = marked no-connect by the designer): U29 7(TOP_TON)* 12(FBP)* 24(TOPDIG)* 25(TONDIG)* 26(GPIO_2_TINDIG)* 27(GPIO_1_TIPDIG)* 33(SDA)* 36(SCL)*

### Notes on the sheet
- Pressure sensor AFE 1
- To program the OTP memory, an external VP_OTP voltage needs to be applied to the VP_OTP pin.
- When Gate Drive is not being used, the GATE pin must be connected to GND and gate control must be disabled by setting
- (near U29) The FBP pin is not used in voltage mode.
- Supply voltage = +3.3 V to 30 V
  Current Supply = 2.6 mA
  Ambient temperature range: : –40°C to +150°C
- fSCK 1 MHz (MAX)
- Title
- Size:
- A4
- Number:
- Revision:
- Date:
- Time:
- Sheet
- of

### Library data of the parts
C140-C142 C144-C149 = CMP-001-1980-2: as C59-C62 on sheet Accelerometers; Height max: 550µm; ComponentLink3Description: Digikey; Mounting Type: SM; ComponentLink3URL: https://www.digikey.com/en/products/detail/murata-electronics/GCM155L8EH104KE07D/11618823; Package: 0402 (1005 Metric); Lead Spacing: 0mm; MPN: GCM155L8EH104KE07D; Size: 1.00mm x 0.50mm; Ratings: AEC-Q200; ComponentLink1URL: https://www.murata.com/en-us/products/productdetail?partno=GCM155L8EH104KE07%23; ComponentLink1Description: Datasheet; Dielectric: X8L; ComponentLink2Description: Mouser; ComponentLink2URL: https://eu.mouser.com/ProductDetail/Murata-Electronics/GCM155L8EH104KE07D?qs=1mbolxNpo8fQSHf0HYnZWw%3D%3D
C143 = CMP-001-2011-2: CAP CER 0402 560PF 16V ULTRA STA; Manufacturer: KEMET; Dielectric: X8R; Tolerance: 1%; Op Temp max: 150°C; Op Temp min: -55°C; Package: 0402 (1005 Metric); MPN: C0402C561F4HACAUTO; ComponentLink3Description: Digikey; Mounting Type: SM; Height max: 550µm; Lead Spacing: 0mm; ComponentLink1Description: Datasheet; ComponentLink3URL: https://www.digikey.com/en/products/detail/kemet/C0402C561F4HACAUTO/7955183?s=N4IgjCBcpgbFoDGUBmBDANgZwKYBoQB7KAbRAGYBOMAVgA4QBdAgBwBcoQBlNgJwEsAdgHMQAXwJgA7AhDJI6bPiKkQAFgBMGzfGYh2nHgJHiCGmhtnzFuAsUhltGyuQh6DkbnyGiJ4SnSUVqiYtioOIAAMTH4akWpB0HIhSnaqNLCRAAQsAGJMrByeAKqC-GwA8igAsjhoWACuvDimIAC0lknyfA3K9mQ0MbHpmSwoMUA; ComponentLink2URL: https://eu.mouser.com/ProductDetail/KEMET/C0402C561F4HACAUTO?qs=j%252B1pi9TdxUZljUlO6hXHJQ%3D%3D; ComponentLink2Description: Mouser; ComponentLink1URL: https://www.kemet.com/en/us/product/C0402C561F4HACAUTO.html; Ratings: AEC-Q200; Size: 1.00mm x 0.50mm
FB12 = CMP-001-1981-1: as FB8-FB10 on sheet Accelerometers; Mounting Type: SM; Size: 1.60mm x 0.80mm; ComponentLink2URL: https://eu.mouser.com/ProductDetail/Murata-Electronics/BLM18KG221BH1D?qs=sJ5gq5MLFXpgEHYBdWUtkQ%3D%3D; ComponentLink1Description: Datasheet; ComponentLink1URL: https://www.murata.com/en-us/products/productdata/8798137286686/QNFA9129.pdf; Lead Spacing: 0mm; Ratings: AEC-Q200; ComponentLink3Description: Digikey; ComponentLink3URL: https://www.digikey.com/en/products/detail/murata-electronics/BLM18KG221BH1D/6156000; Height max: 950µm; Package: 0603 (1608 Metric); ComponentLink2Description: Mouser; MPN: BLM18KG221BH1D
R187 = CMP-001-0927-2: as R134 on sheet Phase_Current_Voltage_Sense; Height max: 550µm; ComponentLink2URL: https://eu.mouser.com/ProductDetail/YAGEO/RC0603FR-070RL?qs=0yPvnVz5%2FmpDQv43TwvCfw%3D%3D; Temperature Coefficient: -; ComponentLink3Description: Digikey; ComponentLink2Description: Mouser; MPN: RC0603FR-070RL; ComponentLink1URL: https://www.yageo.com/upload/media/product/productsearch/datasheet/rchip/PYu-RC_Group_51_RoHS_L_12.pdf; Ratings: -; Size: 1.60mm x 0.80mm; Composition: Thick Film; Mounting Type: SM; ComponentLink3URL: https://www.digikey.com/en/products/detail/yageo/RC0603FR-070RL/1304008; Package: 0603 (1608 Metric); ComponentLink1Description: Datasheet
R188 = CMP-001-0277-7: as R96-R98 on sheet Accelerometers; ComponentLink1URL: https://www.yageo.com/upload/media/product/productsearch/datasheet/rchip/PYu-RC_Group_51_RoHS_L_12.pdf; ComponentLink1Description: Datasheet; MPN: RC0402FR-0747K5L; ComponentLink3Description: Digikey; ComponentLink2URL: https://eu.mouser.com/ProductDetail/YAGEO/RC0402FR-0747K5L?qs=V1yeUXFNrklfu86Rfgihxg%3D%3D; Mounting Type: SM; Tolerance: 1%; Package: 0402 (1005 Metric); Height max: 400µm; ComponentLink2Description: Mouser; ComponentLink3URL: https://www.digikey.com/en/products/detail/yageo/RC0402FR-0747K5L/726617; Size: 1.00mm x 0.50mm; Composition: Thick Film; Ratings: -
R189 R191 R193 R194 = CMP-001-0482-4: as R99-R102 on sheet Accelerometers; Ratings: -; ComponentLink3URL: https://www.digikey.com/en/products/detail/yageo/RC0402FR-0722RL/726562; ComponentLink2URL: https://eu.mouser.com/ProductDetail/YAGEO/RC0402FR-0722RL?qs=V1yeUXFNrkkRg6zf08ADKQ%3D%3D; MPN: RC0402FR-0722RL; ComponentLink1Description: Datasheet; ComponentLink3Description: Digikey; Tolerance: 1%; Size: 1.00mm x 0.50mm; ComponentLink1URL: https://www.yageo.com/upload/media/product/productsearch/datasheet/rchip/PYu-RC_Group_51_RoHS_L_12.pdf; Composition: Thick Film; ComponentLink2Description: Mouser; Mounting Type: SM; Package: 0402 (1005 Metric); Height max: 400µm
R190 R192 = CMP-00010-6: as R145 on sheet Phase_Current_Voltage_Sense; ComponentLink3URL: https://www.digikey.com/en/products/detail/yageo/RC0402FR-0710KL/726523; ComponentLink1Description: Datasheet; Height max: 400µm; ComponentLink3Description: Digikey; ComponentLink2URL: https://www2.mouser.com/ProductDetail/YAGEO/RC0402FR-0710KL?qs=%2Fha2pyFaduhjtLcYvKXQ8NAGbRXkQ%2Fwl6RsvWHeV66MSeqLhkcF3rg%3D%3D; Ratings: -; MPN: RC0402FR-0710KL; ComponentLink1URL: https://www.yageo.com/upload/media/product/productsearch/datasheet/rchip/PYu-RC_Group_51_RoHS_L_12.pdf; ComponentLink2Description: Mouser; Mounting Type: SM; Tolerance: 1%; Composition: Thick Film; Size: 1.00mm x 0.50mm; Package: 0402 (1005 Metric)
R195 = CMP-001-0920-3: DNP res 0603; Mounting Type: SM; MPN: DNP; Package: 0603 (1608 Metric)
R196 = CMP-001-0497-6: RES 110 OHM 1% 1/16W 0402; Manufacturer: YAGEO; Power: 63mW; Op Temp min: -55°C; Op Temp max: 155°C; Temperature Coefficient: ±100ppm; Size: 1.00mm x 0.50mm; ComponentLink1Description: Datasheet; Package: 0402 (1005 Metric); ComponentLink2URL: https://eu.mouser.com/ProductDetail/YAGEO/RC0402FR-07110RL?qs=QWYorlrD8IXj7iGvwWbRbA%3D%3D; MPN: RC0402FR-07110RL; ComponentLink3Description: Digikey; Height max: 400µm; Ratings: -; ComponentLink3URL: https://www.digikey.com/en/products/detail/yageo/RC0402FR-07110RL/2827583; Composition: Thick Film; ComponentLink2Description: Mouser; Tolerance: 1%; Mounting Type: SM; ComponentLink1URL: https://www.yageo.com/upload/media/product/productsearch/datasheet/rchip/PYu-RC_Group_51_RoHS_L_12.pdf
TP28 TP33 TP34 TP36 TP37 = TP_1.5
TP29-TP32 TP92 = TP_0.75: Test point 0.75mm
TP35 = TPAD: Test Pad, SMD; Group: Test point
U29 = PGA900ARHHR: IC PROG SENSOR SGNL COND 36VQFN; Manufacturer: Texas Instruments; MPN: PGA900ARHHR

## Sheet Calendar.SchDoc: =DT_SCH_Title
size A4; Organization: Droid Technologies; DocumentNumber: DT10965; Revision: 1.0; SheetNumber: 16; SheetTotal: 20
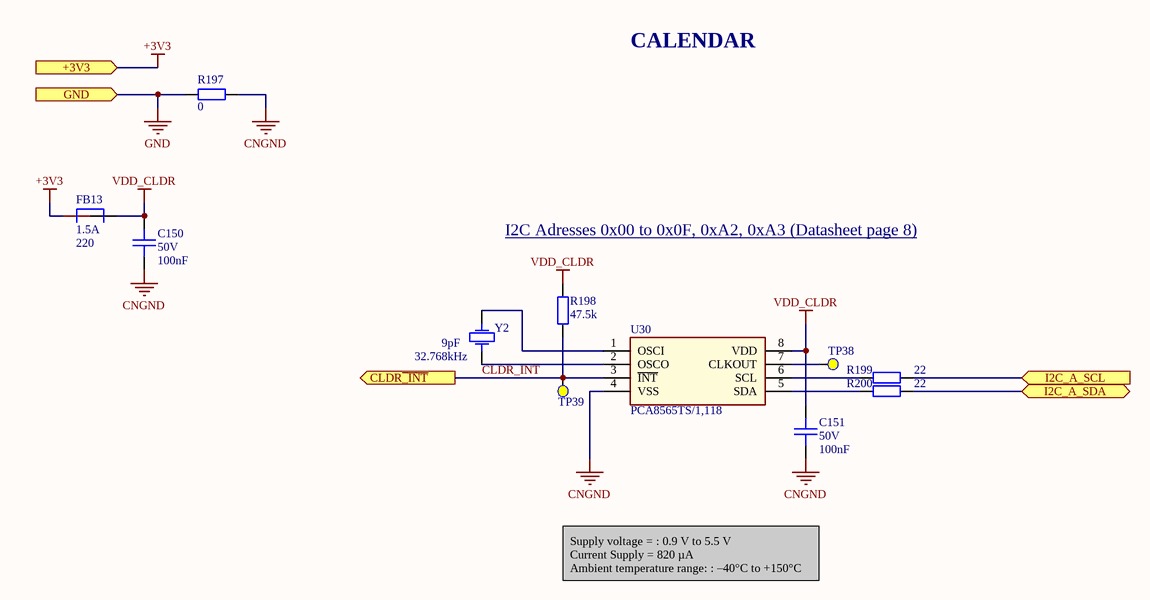
[diagram p12: Calendar.SchDoc]

### Parts
C150  Voltage Rating: 50V  Capacitance: 100nF  [CAPC100x50x50L25]  (hidden comment: GCM155L8EH104KE07D)
C151  Voltage Rating: 50V  Capacitance: 100nF  [CAPC100x50x50L25]  (hidden comment: GCM155L8EH104KE07D)
FB13  Imax: 1.5A  Impedance: 220  [BEADC160X80X95L40]  (hidden comment: BLM18KG221BH1D)
R197  Resistance: 0  [RESC160X80X55L30]  (hidden comment: RC0603FR-070RL)
R198  Resistance: 47.5k  [RESC100X50X40L25]  (hidden comment: RC0402FR-0747K5L)
R199  Resistance: 22  [RESC100X50X40L25]  (hidden comment: RC0402FR-0722RL)
R200  Resistance: 22  [RESC100X50X40L25]  (hidden comment: RC0402FR-0722RL)
TP38  TPAD  [PAD_1.0R]  (value not drawn)  (no BOM)
TP39  TPAD  [PAD_1.0R]  (value not drawn)  (no BOM)
U30  PCA8565TS/1,118  [MINISOIC-8]
Y2  C load: 9pF  F: 32.768kHz  [XTALDFN2_320X150X85L75X150]  (hidden comment: ABS07AIG-32.768KHZ-9-1-T)

### Ports
+3V3 (in), CLDR~{_INT} (out), GND (in), I2C_A_SCL (in), I2C_A_SDA (bidir)

### Nets
+3V3: FB13.1 ; port +3V3
CNGND: C150.1 C151.1 R197.1 U30.4(VSS)
GND: R197.2 ; port GND
VDD_CLDR: C150.2 C151.2 FB13.2 R198.2 U30.8(VDD)
CLDR~{_INT}: R198.1 TP39.1(TPoint) U30.3(~{INT}) ; port CLDR~{_INT}
I2C_A_SCL: R199.2 ; port I2C_A_SCL
I2C_A_SDA: R200.2 ; port I2C_A_SDA
NetR199_1: R199.1 U30.6(SCL)
NetR200_1: R200.1 U30.5(SDA)
NetTP38_1: TP38.1(TPoint) U30.7(CLKOUT)
NetU30_1: U30.1(OSCI) Y2.1
NetU30_2: U30.2(OSCO) Y2.2

### Notes on the sheet
- CALENDAR
- I2C Adresses 0x00 to 0x0F, 0xA2, 0xA3 (Datasheet page 8) <https://www.nxp.com/docs/en/data-sheet/PCA8565.pdf>
- Supply voltage = : 0.9 V to 5.5 V
  Current Supply = 820 µA
  Ambient temperature range: : –40°C to +150°C
- Title
- Size:
- A4
- Number:
- Revision:
- Date:
- Time:
- Sheet
- of

### Library data of the parts
C150 C151 = CMP-001-1980-2: as C59-C62 on sheet Accelerometers; Height max: 550µm; ComponentLink3Description: Digikey; Mounting Type: SM; ComponentLink3URL: https://www.digikey.com/en/products/detail/murata-electronics/GCM155L8EH104KE07D/11618823; Package: 0402 (1005 Metric); Lead Spacing: 0mm; MPN: GCM155L8EH104KE07D; Size: 1.00mm x 0.50mm; Ratings: AEC-Q200; ComponentLink1URL: https://www.murata.com/en-us/products/productdetail?partno=GCM155L8EH104KE07%23; ComponentLink1Description: Datasheet; Dielectric: X8L; ComponentLink2Description: Mouser; ComponentLink2URL: https://eu.mouser.com/ProductDetail/Murata-Electronics/GCM155L8EH104KE07D?qs=1mbolxNpo8fQSHf0HYnZWw%3D%3D
FB13 = CMP-001-1981-1: as FB8-FB10 on sheet Accelerometers; Mounting Type: SM; Size: 1.60mm x 0.80mm; ComponentLink2URL: https://eu.mouser.com/ProductDetail/Murata-Electronics/BLM18KG221BH1D?qs=sJ5gq5MLFXpgEHYBdWUtkQ%3D%3D; ComponentLink1Description: Datasheet; ComponentLink1URL: https://www.murata.com/en-us/products/productdata/8798137286686/QNFA9129.pdf; Lead Spacing: 0mm; Ratings: AEC-Q200; ComponentLink3Description: Digikey; ComponentLink3URL: https://www.digikey.com/en/products/detail/murata-electronics/BLM18KG221BH1D/6156000; Height max: 950µm; Package: 0603 (1608 Metric); ComponentLink2Description: Mouser; MPN: BLM18KG221BH1D
R197 = CMP-001-0927-2: as R134 on sheet Phase_Current_Voltage_Sense; Height max: 550µm; ComponentLink2URL: https://eu.mouser.com/ProductDetail/YAGEO/RC0603FR-070RL?qs=0yPvnVz5%2FmpDQv43TwvCfw%3D%3D; Temperature Coefficient: -; ComponentLink3Description: Digikey; ComponentLink2Description: Mouser; MPN: RC0603FR-070RL; ComponentLink1URL: https://www.yageo.com/upload/media/product/productsearch/datasheet/rchip/PYu-RC_Group_51_RoHS_L_12.pdf; Ratings: -; Size: 1.60mm x 0.80mm; Composition: Thick Film; Mounting Type: SM; ComponentLink3URL: https://www.digikey.com/en/products/detail/yageo/RC0603FR-070RL/1304008; Package: 0603 (1608 Metric); ComponentLink1Description: Datasheet
R198 = CMP-001-0277-7: as R96-R98 on sheet Accelerometers; ComponentLink1URL: https://www.yageo.com/upload/media/product/productsearch/datasheet/rchip/PYu-RC_Group_51_RoHS_L_12.pdf; ComponentLink1Description: Datasheet; MPN: RC0402FR-0747K5L; ComponentLink3Description: Digikey; ComponentLink2URL: https://eu.mouser.com/ProductDetail/YAGEO/RC0402FR-0747K5L?qs=V1yeUXFNrklfu86Rfgihxg%3D%3D; Mounting Type: SM; Tolerance: 1%; Package: 0402 (1005 Metric); Height max: 400µm; ComponentLink2Description: Mouser; ComponentLink3URL: https://www.digikey.com/en/products/detail/yageo/RC0402FR-0747K5L/726617; Size: 1.00mm x 0.50mm; Composition: Thick Film; Ratings: -
R199 R200 = CMP-001-0482-4: as R99-R102 on sheet Accelerometers; Ratings: -; ComponentLink3URL: https://www.digikey.com/en/products/detail/yageo/RC0402FR-0722RL/726562; ComponentLink2URL: https://eu.mouser.com/ProductDetail/YAGEO/RC0402FR-0722RL?qs=V1yeUXFNrkkRg6zf08ADKQ%3D%3D; MPN: RC0402FR-0722RL; ComponentLink1Description: Datasheet; ComponentLink3Description: Digikey; Tolerance: 1%; Size: 1.00mm x 0.50mm; ComponentLink1URL: https://www.yageo.com/upload/media/product/productsearch/datasheet/rchip/PYu-RC_Group_51_RoHS_L_12.pdf; Composition: Thick Film; ComponentLink2Description: Mouser; Mounting Type: SM; Package: 0402 (1005 Metric); Height max: 400µm
TP38 TP39 = TPAD: Test Pad, SMD; Group: Test point
U30 = PCA8565TS/1,118: IC RTC CLK/CALENDAR I2C 8TSSOP; Manufacturer: NXP USA Inc.; MPN: PCA8565TS/1,118
Y2 = CMP-001-1983-1: CRYSTAL 32.7680KHZ 9PF SMD; Manufacturer: Abracon LLC; ESR: 80k; Op Temp max: 125°C; Op Temp min: -40°C; F Tolerance: ±10ppm; Height max: 900µm; ComponentLink2Description: Mouser; Mounting Type: SM; ComponentLink3Description: Digikey; MPN: ABS07AIG-32.768KHZ-9-1-T; ComponentLink1URL: https://abracon.com/datasheets/ABS07AIG.pdf; ComponentLink2URL: https://eu.mouser.com/ProductDetail/ABRACON/ABS07AIG-32.768KHZ-9-1-T?qs=gG6m684uYP5Ouz7KwhjT2A%3D%3D; ComponentLink1Description: Datasheet; Size: 3.20mm x 1.50mm; ComponentLink3URL: https://www.digikey.com/en/products/detail/abracon-llc/ABS07AIG-32-768KHZ-9-1-T/5817553; Package: 2-SMD, No Lead; F Stability: -; Ratings: AEC-Q200

## Sheet USB_interface.SchDoc: =DT_SCH_Title
size A4; Organization: Droid Technologies; DocumentNumber: DT10965; Revision: 1.0; SheetNumber: 16; SheetTotal: 18
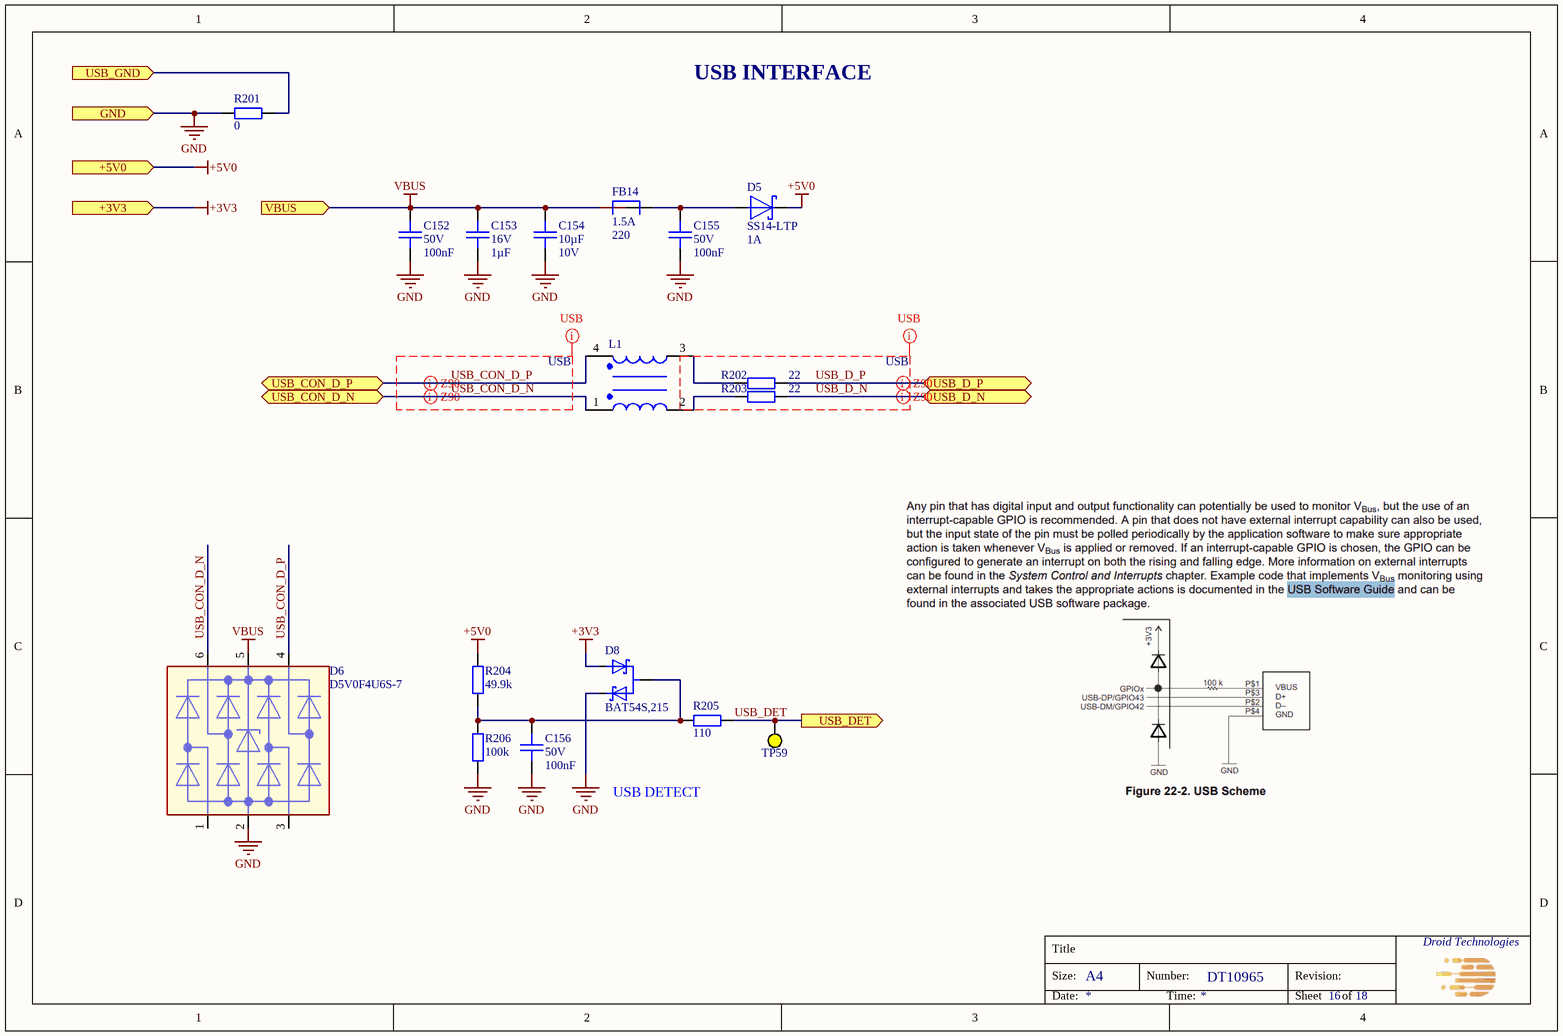
[diagram p13: USB_interface.SchDoc]

### Parts
C152  Voltage Rating: 50V  Capacitance: 100nF  [CAPC100x50x50L25]  (hidden comment: GCM155L8EH104KE07D)
C153  Voltage Rating: 16V  Capacitance: 1µF  [CAPC160X80X90L35]  (hidden comment: GCG188L8EE105KA07D)
C154  Capacitance: 10µF  Voltage Rating: 10V  [CAPC200X125X145L50]  (hidden comment: CGA4J1X8L1A106K125AC)
C155  Voltage Rating: 50V  Capacitance: 100nF  [CAPC100x50x50L25]  (hidden comment: GCM155L8EH104KE07D)
C156  Voltage Rating: 50V  Capacitance: 100nF  [CAPC100x50x50L25]  (hidden comment: GCM155L8EH104KE07D)
D5  Current - Average Rectified (Io): 1A  [DIOM520X260X290XL115X145]  (hidden comment: SS14-LTP)
D6  D5V0F4U6S-7  [SOP6P65_200X210X90L85X20]
D8  BAT54S,215  [SOT23-3P95_237X112L50X40]
FB14  Imax: 1.5A  Impedance: 220  [BEADC160X80X95L40]  (hidden comment: BLM18KG221BH1D)
L1  2 Line Common Mode Choke  [DLW21HN900SQ2L]  (value not drawn)
R201  Resistance: 0  [RESC160X80X55L30]  (hidden comment: RC0603FR-070RL)
R202  Resistance: 22  [RESC100X50X40L25]  (hidden comment: RC0402FR-0722RL)
R203  Resistance: 22  [RESC100X50X40L25]  (hidden comment: RC0402FR-0722RL)
R204  Resistance: 49.9k  [RESC100X50X40L25]  (hidden comment: RC0402FR-0749K9L)
R205  Resistance: 110  [RESC100X50X40L25]  (hidden comment: RC0402FR-07110RL)
R206  Resistance: 100k  [RESC100X50X40L25]  (hidden comment: RC0402FR-07100KL)
TP59  Test Point  [TP_D0.75mm]  (value not drawn)

### Ports
+3V3 (in), +5V0 (in), GND (in), USB_CON_D_N (bidir), USB_CON_D_P (bidir), USB_D_N (bidir), USB_D_P (bidir), USB_DET (out), USB_GND (in), VBUS (in)

### Nets
+3V3: D8.1 ; port +3V3
+5V0: D5.1 R204.2 ; port +5V0
GND: C152.1 C153.1 C154.1 C155.1 C156.1 D6.2 D8.2 R201.2 R206.1 ; port GND
VBUS: C152.2 C153.2 C154.2 D6.5 FB14.1 ; port VBUS
USB_CON_D_N: D6.6 L1.1 ; port USB_CON_D_N
USB_CON_D_P: D6.4 L1.4 ; port USB_CON_D_P
USB_D_N: R203.2 ; port USB_D_N
USB_D_P: R202.2 ; port USB_D_P
USB_DET: R205.2 TP59.1 ; port USB_DET
NetC155_2: C155.2 D5.2 FB14.2
NetC156_2: C156.2 D8.3 R204.1 R205.1 R206.2
NetL1_2: L1.2 R203.1
NetL1_3: L1.3 R202.1
NetR201_1: R201.1 ; port USB_GND

Not connected (* = marked no-connect by the designer): D6 1 3

### Layout directives
differential pair: USB_CON_D_N, USB_CON_D_P, USB_D_N, USB_D_P
net class USB: USB_CON_D_N, USB_CON_D_P, USB_D_N, USB_D_P

### Notes on the sheet
- USB INTERFACE
- USB DETECT
- Title
- Size:
- A4
- Number:
- Revision:
- Date:
- Time:
- Sheet
- of

### Library data of the parts
C152 C155 C156 = CMP-001-1980-2: as C59-C62 on sheet Accelerometers; Height max: 550µm; ComponentLink3Description: Digikey; Mounting Type: SM; ComponentLink3URL: https://www.digikey.com/en/products/detail/murata-electronics/GCM155L8EH104KE07D/11618823; Package: 0402 (1005 Metric); Lead Spacing: 0mm; MPN: GCM155L8EH104KE07D; Size: 1.00mm x 0.50mm; Ratings: AEC-Q200; ComponentLink1URL: https://www.murata.com/en-us/products/productdetail?partno=GCM155L8EH104KE07%23; ComponentLink1Description: Datasheet; Dielectric: X8L; ComponentLink2Description: Mouser; ComponentLink2URL: https://eu.mouser.com/ProductDetail/Murata-Electronics/GCM155L8EH104KE07D?qs=1mbolxNpo8fQSHf0HYnZWw%3D%3D
C153 = CMP-001-1982-2: CAP CER 1UF 16V X8L 0603; Manufacturer: Murata Electronics; Tolerance: 10%; Op Temp min: -55°C; Op Temp max: 150°C; ComponentLink3URL: https://www.digikey.com/en/products/detail/murata-electronics/GCG188L8EE105KA07D/10695125; Package: 0603 (1608 Metric); MPN: GCG188L8EE105KA07D; ComponentLink2URL: https://eu.mouser.com/ProductDetail/Murata-Electronics/GCG188L8EE105KA07D?qs=rrS6PyfT74dFMfTR80dVTA%3D%3D; Dielectric: X8L; Size: 1.60mm x 0.80mm; ComponentLink1Description: Datasheet; ComponentLink1URL: https://www.murata.com/en-us/products/productdetail?partno=GCG188L8EE105KA07%23; ComponentLink2Description: Mouser; Height max: 900µm; Mounting Type: SM; ComponentLink3Description: Digikey; Lead Spacing: 0mm; Ratings: AEC-Q200
C154 = CMP-001-1984-2: CAP CER 10UF 10V X8L 0805; Manufacturer: TDK Corporation; Tolerance: 10%; Op Temp min: -55°C; Op Temp max: 150°C; ComponentLink3Description: Digikey; Mounting Type: SM; Ratings: AEC-Q200; ComponentLink1Description: Datasheet; ComponentLink3URL: https://www.digikey.com/en/products/detail/tdk-corporation/CGA4J1X8L1A106K125AC/9991388; Lead Spacing: 0mm; MPN: CGA4J1X8L1A106K125AC; Size: 2.00mm x 1.25mm; Height max: 1.5mm; ComponentLink2URL: https://eu.mouser.com/ProductDetail/TDK/CGA4J1X8L1A106K125AC?qs=gZXFycFWdANzH%252B2UvJJjtQ%3D%3D; Package: 0805 (2012 Metric); ComponentLink2Description: Mouser; Dielectric: X8L; ComponentLink1URL: https://product.tdk.com/en/search/capacitor/ceramic/mlcc/info?part_no=CGA4J1X8L1A106K125AC
D5 = CMP-001-0248-5: DIODE SCHOTTKY 40V 1A DO214AC; Manufacturer: Micro Commercial Co; Capacitance: 52pF; Op Temp max: 125°C; Op Temp min: -55°C; Reverse Recovery Time (trr): 0s; Voltage - Forward (Vf) (Max) @ If: 500 mV @ 1 A; ComponentLink1URL: https://www.mccsemi.com/pdf/Products/SS12-L-SS110-L(DO-214AC).pdf; Height max: 2.44mm; ComponentLink1Description: Datasheet; Package: DO-214AC, SMA; ComponentLink2Description: Mouser; Size: 5.2x2.6; Diode Type: Schottky; ComponentLink3Description: Digikey; MPN: SS14-LTP; ComponentLink2URL: https://www2.mouser.com/ProductDetail/Micro-Commercial-Components-MCC/SS14-LTP?qs=%2Fha2pyFadujIpB0%252ByFcAqIT7YGlaGT7g1IJJK3bT00s%3D; ComponentLink3URL: https://www.digikey.com/en/products/detail/micro-commercial-co/SS14-LTP/7652330?s=N4IgTCBcDaIMpwIwBYC0AZAKgBRAXQF8g; Voltage - DC Reverse (Vr) (Max): 40V; Mounting Type: SM
D6 = CMP-001-1245-2: TVS DIODE 5.5VWM 12VC SOT363; Manufacturer: Diodes Incorporated; Cap @ Freq: 0.5pF @ 1MHz; Vc: 12V; Op Temp max: 150°C; Unidirectional Channels: 4; P: 200mW; Vbr: 6V; Vrwm: 5.5V; Op Temp min: -55°C; Height max: 1.1mm; ComponentLink3URL: https://www.digikey.com/en/products/detail/diodes-incorporated/D5V0F4U6S-7/7724995?s=N4IgTCBcDaICIFYBqAGAYgFgKoDYDKAtAOwgC6AvkA; Bidirectional Channels: -; Size: 2.15mm x 2.1mm; Mounting Type: SM; ComponentLink1Description: Datasheet; ComponentLink2Description: Mouser; Package: 6-TSSOP, SC-88, SOT-363; MPN: D5V0F4U6S-7; Ratings: -; ComponentLink1URL: https://www.diodes.com/assets/Datasheets/D5V0F4U6S.pdf; ComponentLink2URL: https://eu.mouser.com/ProductDetail/Diodes-Incorporated/D5V0F4U6S-7?qs=L1DZKBg7t5HMc2d93K7aHQ%3D%3D; ComponentLink3Description: Digikey
D8 = BAT54S,215: DIODE ARR SCHOTT 30V TO236AB; Manufacturer: Nexperia USA Inc.; Diode Configuration: 1 Pair Series Connection; Current - Average Rectified (Io) (per Diode): 200mA; Voltage - Forward (Vf) (Max) @ If: 800 mV @ 100 mA; Reverse Recovery Time (trr): 5 ns; Current - Reverse Leakage @ Vr: 2 µA @ 25 V; MPN: BAT54S,215; Technology: Schottky; Voltage - DC Reverse (Vr) (Max): 30 V; ComponentLink1Description: DigiKey; ComponentLink1URL: https://www.digikey.bg/en/products/detail/nexperia-usa-inc/BAT54S-215/763218; Operating Temperature - Junction: 150°C (Max); Package / Case: TO-236-3, SC-59, SOT-23-3; Mounting Type: SM; ComponentLink2Description: Datasheet; ComponentLink2URL: https://assets.nexperia.com/documents/data-sheet/BAT54S.pdf
FB14 = CMP-001-1981-1: as FB8-FB10 on sheet Accelerometers; Mounting Type: SM; Size: 1.60mm x 0.80mm; ComponentLink2URL: https://eu.mouser.com/ProductDetail/Murata-Electronics/BLM18KG221BH1D?qs=sJ5gq5MLFXpgEHYBdWUtkQ%3D%3D; ComponentLink1Description: Datasheet; ComponentLink1URL: https://www.murata.com/en-us/products/productdata/8798137286686/QNFA9129.pdf; Lead Spacing: 0mm; Ratings: AEC-Q200; ComponentLink3Description: Digikey; ComponentLink3URL: https://www.digikey.com/en/products/detail/murata-electronics/BLM18KG221BH1D/6156000; Height max: 950µm; Package: 0603 (1608 Metric); ComponentLink2Description: Mouser; MPN: BLM18KG221BH1D
L1 = AWCU00201212900M02: CMC 330MA 2LN 90OHM SMD AEC-Q200; Manufacturer: Pulse Electronics; MPN: AWCU00201212900M02
R201 = CMP-001-0927-2: as R134 on sheet Phase_Current_Voltage_Sense; Height max: 550µm; ComponentLink2URL: https://eu.mouser.com/ProductDetail/YAGEO/RC0603FR-070RL?qs=0yPvnVz5%2FmpDQv43TwvCfw%3D%3D; Temperature Coefficient: -; ComponentLink3Description: Digikey; ComponentLink2Description: Mouser; MPN: RC0603FR-070RL; ComponentLink1URL: https://www.yageo.com/upload/media/product/productsearch/datasheet/rchip/PYu-RC_Group_51_RoHS_L_12.pdf; Ratings: -; Size: 1.60mm x 0.80mm; Composition: Thick Film; Mounting Type: SM; ComponentLink3URL: https://www.digikey.com/en/products/detail/yageo/RC0603FR-070RL/1304008; Package: 0603 (1608 Metric); ComponentLink1Description: Datasheet
R202 R203 = CMP-001-0482-4: as R99-R102 on sheet Accelerometers; Ratings: -; ComponentLink3URL: https://www.digikey.com/en/products/detail/yageo/RC0402FR-0722RL/726562; ComponentLink2URL: https://eu.mouser.com/ProductDetail/YAGEO/RC0402FR-0722RL?qs=V1yeUXFNrkkRg6zf08ADKQ%3D%3D; MPN: RC0402FR-0722RL; ComponentLink1Description: Datasheet; ComponentLink3Description: Digikey; Tolerance: 1%; Size: 1.00mm x 0.50mm; ComponentLink1URL: https://www.yageo.com/upload/media/product/productsearch/datasheet/rchip/PYu-RC_Group_51_RoHS_L_12.pdf; Composition: Thick Film; ComponentLink2Description: Mouser; Mounting Type: SM; Package: 0402 (1005 Metric); Height max: 400µm
R204 = CMP-00547-4: RES 49.9K OHM 1% 1/16W 0402; Manufacturer: YAGEO; Temperature Coefficient: ±100ppm; Power: 63mW; Op Temp min: -55°C; Op Temp max: 155°C; ComponentLink1Description: Datasheet; Composition: Thick Film; Ratings: -; ComponentLink2URL: https://eu.mouser.com/ProductDetail/YAGEO/RC0402FR-0749K9L?qs=QT1cPpUoD8GsWnpgOWR2jA%3D%3D; ComponentLink3URL: https://www.digikey.com/en/products/detail/yageo/RC0402FR-0749K9L/726620; ComponentLink2Description: Mouser; MPN: RC0402FR-0749K9L; Package: 0402 (1005 Metric); Mounting Type: SM; ComponentLink1URL: https://www.yageo.com/upload/media/product/productsearch/datasheet/rchip/PYu-RC_Group_51_RoHS_L_12.pdf; Size: 1.00mm x 0.50mm; Tolerance: 1%; ComponentLink3Description: Digikey; Height max: 400µm
R205 = CMP-001-0497-6: as R196 on sheet Pressure_sensor_AFE1; Size: 1.00mm x 0.50mm; ComponentLink1Description: Datasheet; Package: 0402 (1005 Metric); ComponentLink2URL: https://eu.mouser.com/ProductDetail/YAGEO/RC0402FR-07110RL?qs=QWYorlrD8IXj7iGvwWbRbA%3D%3D; MPN: RC0402FR-07110RL; ComponentLink3Description: Digikey; Height max: 400µm; Ratings: -; ComponentLink3URL: https://www.digikey.com/en/products/detail/yageo/RC0402FR-07110RL/2827583; Composition: Thick Film; ComponentLink2Description: Mouser; Tolerance: 1%; Mounting Type: SM; ComponentLink1URL: https://www.yageo.com/upload/media/product/productsearch/datasheet/rchip/PYu-RC_Group_51_RoHS_L_12.pdf
R206 = CMP-00121-6: as R130 on sheet Phase_Current_Voltage_Sense; ComponentLink2Description: Mouser; Mounting Type: SM; Composition: Thick Film; ComponentLink3URL: https://www.digikey.com/en/products/detail/yageo/RC0402FR-07100KL/726526; Size: 1.00mm x 0.50mm; MPN: RC0402FR-07100KL; Tolerance: 1%; Ratings: -; ComponentLink1Description: Datasheet; ComponentLink2URL: https://eu.mouser.com/ProductDetail/YAGEO/RC0402FR-07100KL?qs=%2Fha2pyFaduhjtLcYvKXQ8IUndG0u%252BuCx1gxMxvN%252Btd7iB7mgHWsSbw%3D%3D; Package: 0402 (1005 Metric); ComponentLink1URL: https://www.yageo.com/upload/media/product/productsearch/datasheet/rchip/PYu-RC_Group_51_RoHS_L_12.pdf; ComponentLink3Description: Digikey; Height max: 400µm
TP59 = TP_0.75: Test point 0.75mm